# EAGLE design rotor_khamex_4.5 (EAGLE 7.6.0)

## Sheet 1 of 2
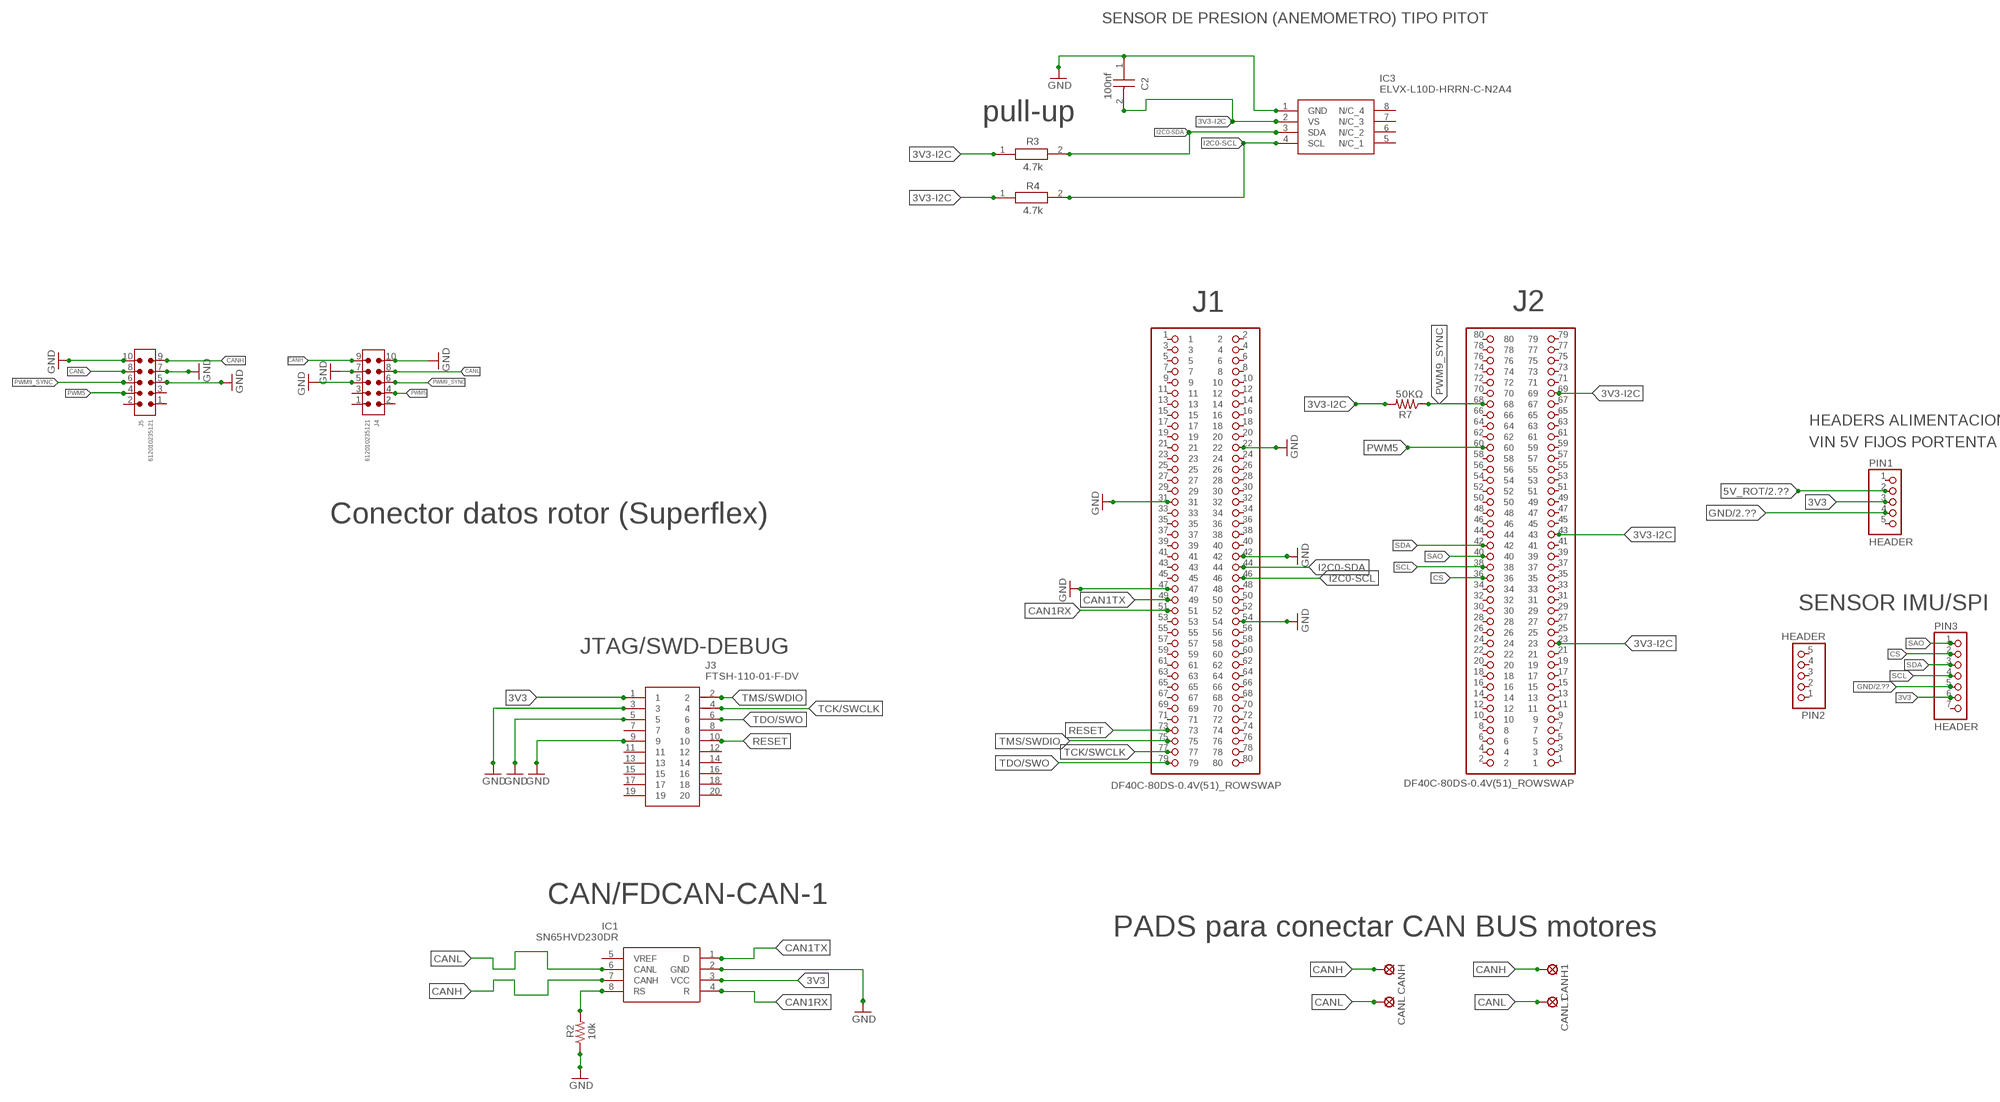
[diagram p0: schematic, sheet 1]

### Parts
C2  100nf  VJ0805Y104KCAAJ  [CAPC2012X145N]
CANH  LSP11  [LSP11]
CANH1  LSP11  [LSP11]
CANL  LSP11  [LSP11]
CANL1  LSP11  [LSP11]
IC1  SN65HVD230DR  [SOT127P600X175-8N]
IC3  ELVX-L10D-HRRN-C-N2A4  [ELVXL10DHRRNCN2A4]
J1  DF40C-80DS-0.4V(51)_ROWSWAP  [HRS_DF40C-80DS-0.4V(51)_ROWSWAP]
J2  DF40C-80DS-0.4V(51)_ROWSWAP  [HRS_DF40C-80DS-0.4V(51)_ROWSWAP]
J3  FTSH-110-01-F-DV  [FTSH-110-XX-YYY-DV]
J4  612010235121  6120XX235121_612010235121  [612010235121]
J5  612010235121  6120XX235121_612010235121  [612010235121]
PIN1  HEADER  PINHD-1X5  [1X05]
PIN2  HEADER  PINHD-1X5  [1X05]
PIN3  HEADER  PINHD-1X7  [1X07]
R2  10k  R-US_M0805  [M0805]
R3  4.7k  CRCW08054K70FKEA  [RESC2012X50N]
R4  4.7k  CRCW08054K70FKEA  [RESC2012X50N]
R7  50KΩ  R-US_M0805  [M0805]

### Nets
3V3: IC1.3(VCC) J3.1 PIN1.3 PIN3.6
3V3-I2C: C2.2 IC3.2(VS) J2.23 J2.43 J2.69 R3.1 R4.1 R7.2
5V_ROT: PIN1.2 ; also sheet 2
CAN1RX: IC1.4(R) J1.51
CAN1TX: IC1.1(D) J1.49
CANH: CANH1.MP CANH.MP IC1.7(CANH) J4.9 J5.9
CANL: CANL1.MP CANL.MP IC1.6(CANL) J4.8 J5.8
CS: J2.36 PIN3.2
GND [power]: C2.1 IC1.2(GND) IC3.1(GND) J1.22 J1.31 J1.42 J1.47 J1.54 J3.3 J3.5 J3.9 J4.5 J4.7 J4.10 J5.5 J5.7 J5.10 PIN1.4 PIN3.5 R2.1 ; also sheet 2
I2C0-SCL: IC3.4(SCL) J1.46 R4.2
I2C0-SDA: IC3.3(SDA) J1.44 R3.2
N$15: IC1.8(RS) R2.2
PWM5: J2.60 J4.4 J5.4
PWM9_SYNC: J2.68 J4.6 J5.6 R7.1
RESET: J1.73 J3.10
SAO: J2.40 PIN3.1
SCL: J2.38 PIN3.4
SDA: J2.42 PIN3.3
TCK/SWCLK: J1.77 J3.4
TDO/SWO: J1.79 J3.6
TMS/SWDIO: J1.75 J3.2
Unconnected: IC1.5(VREF) IC3.5(N/C_1) IC3.6(N/C_2) IC3.7(N/C_3) IC3.8(N/C_4) J1.1 J1.2 J1.3 J1.4 J1.5 J1.6 J1.7 J1.8 J1.9 J1.10 J1.11 J1.12 J1.13 J1.14 J1.15 J1.16 J1.17 J1.18 J1.19 J1.20 J1.21 J1.23 J1.24 J1.25 J1.26 J1.27 J1.28 J1.29 J1.30 J1.32 J1.33 J1.34 J1.35 J1.36 J1.37 J1.38 J1.39 J1.40 J1.41 J1.43 J1.45 J1.48 J1.50 J1.52 J1.53 J1.55 J1.56 J1.57 J1.58 J1.59 J1.60 J1.61 J1.62 J1.63 J1.64 J1.65 J1.66 J1.67 J1.68 J1.69 J1.70 J1.71 J1.72 J1.74 J1.76 J1.78 J1.80 J2.1 J2.2 J2.3 J2.4 J2.5 J2.6 J2.7 J2.8 J2.9 J2.10 J2.11 J2.12 J2.13 J2.14 J2.15 J2.16 J2.17 J2.18 J2.19 J2.20 J2.21 J2.22 J2.24 J2.25 J2.26 J2.27 J2.28 J2.29 J2.30 J2.31 J2.32 J2.33 J2.34 J2.35 J2.37 J2.39 J2.41 J2.44 J2.45 J2.46 J2.47 J2.48 J2.49 J2.50 J2.51 J2.52 J2.53 J2.54 J2.55 J2.56 J2.57 J2.58 J2.59 J2.61 J2.62 J2.63 J2.64 J2.65 J2.66 J2.67 J2.70 J2.71 J2.72 J2.73 J2.74 J2.75 J2.76 J2.77 J2.78 J2.79 J2.80 J3.7 J3.8 J3.11 J3.12 J3.13 J3.14 J3.15 J3.16 J3.17 J3.18 J3.19 J3.20 J4.1 J4.2 J4.3 J5.1 J5.2 J5.3 PIN1.1 PIN1.5 PIN2.1 PIN2.2 PIN2.3 PIN2.4 PIN2.5 PIN3.7

### Notes on the sheet
- SENSOR DE PRESION (ANEMOMETRO) TIPO PITOT
- pull-up
- 4.7k
- 4.7k
- HEADERS ALIMENTACION
- VIN 5V FIJOS PORTENTA
- Conector datos rotor (Superflex)
- SENSOR IMU/SPI
- JTAG/SWD-DEBUG
- CAN/FDCAN-CAN-1
- PADS para conectar CAN BUS motores

## Sheet 2 of 2
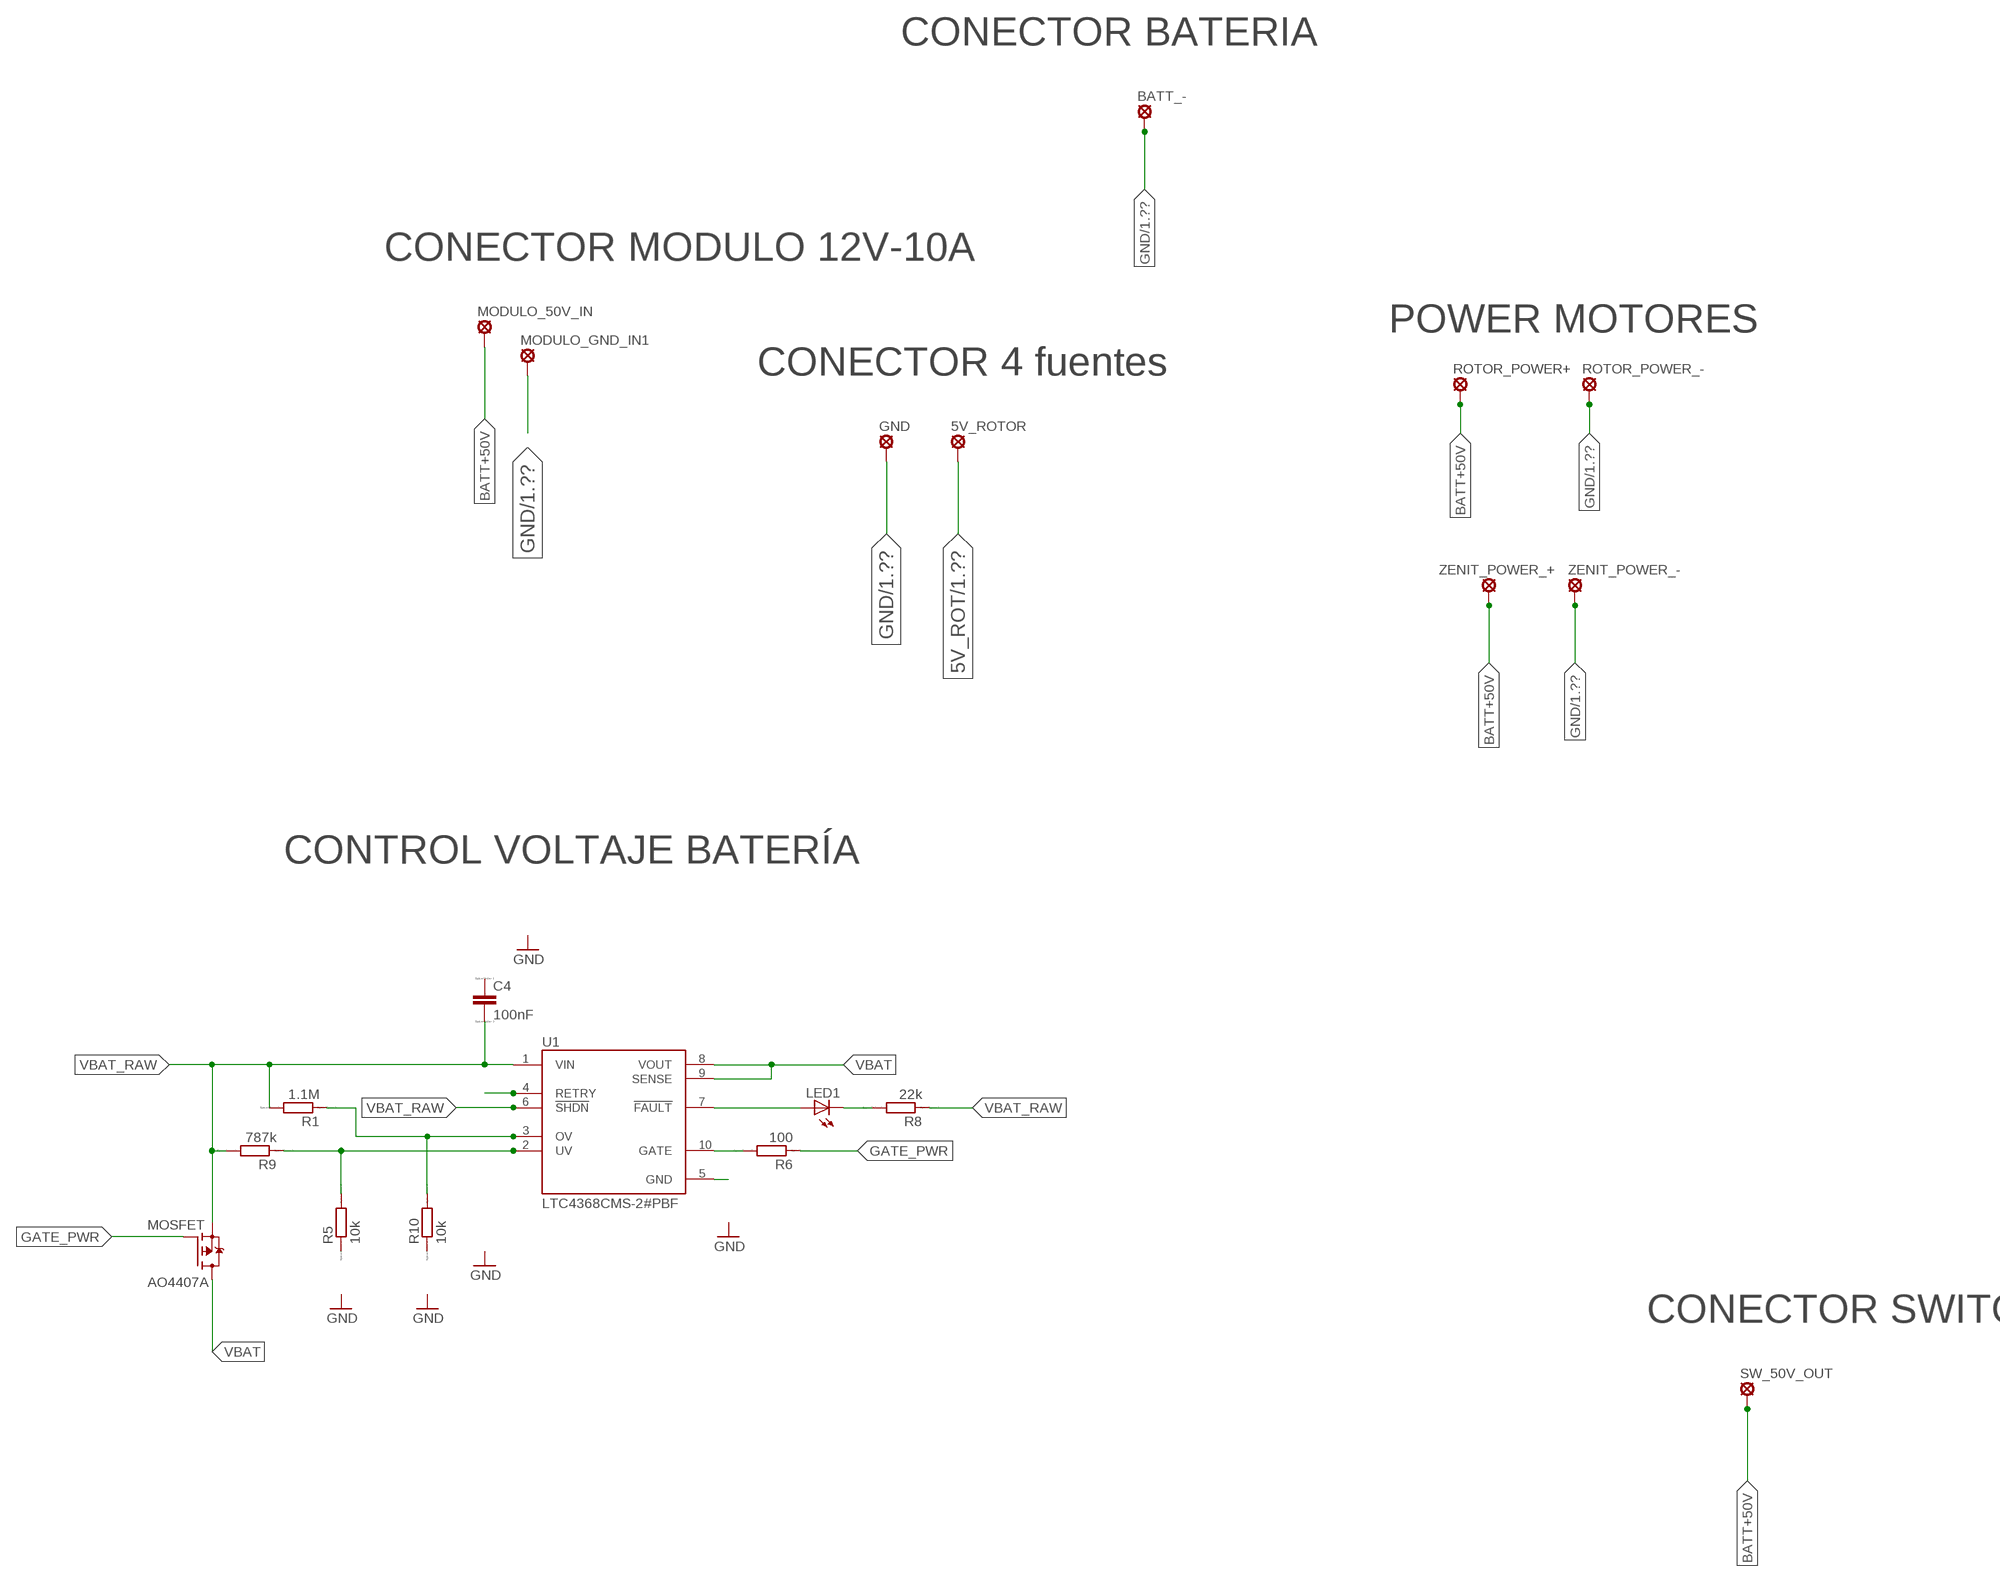
[diagram p1: schematic, sheet 2]

### Parts
5V_ROTOR  SE14  [SE14]
BATT_-  SE14  [SE14]
C4  100nF  C  [C0805]
GND  SE14  [SE14]
LED1  LED  [SMARTLED-TTW]
MODULO_50V_IN  SE14  [SE14]
MODULO_GND_IN1  SE14  [SE14]
MOSFET  AO4407A  [SOIC127P600X175-8N]
R1  1.1M  R  [R0805]
R5  10k  R  [R0805]
R6  100  R  [R0805]
R8  22k  R  [R0805]
R9  787k  R  [R0805]
R10  10k  R  [R0805]
ROTOR_POWER+  SE14  [SE14]
ROTOR_POWER_-  SE14  [SE14]
SW_50V_OUT  SE14  [SE14]
U1  LTC4368CMS-2#PBF  [SOP50P490X110-10N]
ZENIT_POWER_+  SE14  [SE14]
ZENIT_POWER_-  SE14  [SE14]

### Nets
5V_ROT: 5V_ROTOR.MP ; also sheet 1
BATT+50V [power]: MODULO_50V_IN.MP ROTOR_POWER+.MP SW_50V_OUT.MP ZENIT_POWER_+.MP
GATE_PWR: MOSFET.4(G) R6.1
GND [power]: BATT_-.MP GND.MP MODULO_GND_IN1.MP ROTOR_POWER_-.MP ZENIT_POWER_-.MP ; also sheet 1
N$2: LED1.A@1(A) U1.7(!FAULT)
N$11: R5.2 R9.1 U1.2(UV)
N$12: R1.1 R10.2 U1.3(OV)
N$13: LED1.C@1(C) R8.2
N$14: R6.2 U1.10(GATE)
N$20 [power]: U1.4(RETRY)
N$21 [power]: U1.5(GND)
VBAT: MOSFET.5(D) MOSFET.6(D) MOSFET.7(D) MOSFET.8(D) U1.8(VOUT) U1.9(SENSE)
VBAT_RAW: C4.2 MOSFET.1(S) MOSFET.2(S) MOSFET.3(S) R1.2 R8.1 R9.2 U1.1(VIN) U1.6(!SHDN)
Unconnected: C4.1 R5.1 R10.1

### Notes on the sheet
- CONECTOR BATERIA
- CONECTOR MODULO 12V-10A
- POWER MOTORES
- CONECTOR 4 fuentes
- CONTROL VOLTAJE BATERÍA
- CONECTOR SWITCH

## Library data of the parts
5V_ROTOR BATT_- GND MODULO_50V_IN MODULO_GND_IN1 ROTOR_POWER+ ROTOR_POWER_- SW_50V_OUT ZENIT_POWER_+ ZENIT_POWER_- = solpad:SE14: SOLDER PAD E1553, drill 1,4mm, distributor Buerklin, 07F820
C2 = VJ0805Y104KCAAJ:VJ0805Y104KCAAJ: Vishay VJ0805 series Capacitor Chips Source: Datasheet <http://www.vishay.com/docs/45226/vj31xrohsautomlcc.pdf>; DESCRIPTION: Vishay VJ0805 series Capacitor Chips; HEIGHT: 1.45mm; MANUFACTURER_NAME: Vishay; MANUFACTURER_PART_NUMBER: VJ0805Y104KCAAJ
C4 = eagle-ltspice:C: CAPACITOR, European symbol; SPICEMODEL: NONE; SPICEPREFIX: C
CANH CANH1 CANL CANL1 = solpad:LSP11: SOLDER PAD drill 1.1 mm
IC1 = SN65HVD230DR:SN65HVD230DR: 3.3 V CAN Transceiver with Standby Mode Source: Datasheet <http://www.ti.com/lit/gpn/sn65hvd230>; DESCRIPTION: 3.3 V CAN Transceiver with Standby Mode; HEIGHT: 1.75mm; MANUFACTURER_NAME: Texas Instruments; MANUFACTURER_PART_NUMBER: SN65HVD230DR; MOUSER_PART_NUMBER: 595-SN65HVD230DR; MOUSER_PRICE-STOCK: https://www.mouser.co.uk/ProductDetail/Texas-Instruments/SN65HVD230DR?qs=QViXGNcIEAtifeQR3pYVUQ%3D%3D
IC3 = ELVX-L10D-HRRN-C-N2A4:ELVX-L10D-HRRN-C-N2A4: Pressure Sensor +/-0.36PSI (+/-2.49kPa) Differential Male - 0.08" (1.93mm) Tube, Dual 14 b 8-SMD, No Lead, Dual Ports, Same Side, 3.3V, -25C ~ 85C Source: Datasheet <https://allsensors.com/hubfs/Product-Data-Sheets/DS-0452.pdf>; DESCRIPTION: Pressure Sensor +/-0.36PSI (+/-2.49kPa) Differential Male - 0.08" (1.93mm) Tube, Dual 14 b 8-SMD, No Lead, Dual Ports, Same Side, 3.3V, -25C ~ 85C; HEIGHT: 4.33mm; MANUFACTURER_NAME: Amphenol; MANUFACTURER_PART_NUMBER: ELVX-L10D-HRRN-C-N2A4
J1 J2 = DF40C-80DS-0.4V_51_ROWSWAP:DF40C-80DS-0.4V(51)_ROWSWAP; CHECK_PRICES: https://www.snapeda.com/parts/DF40C-80DS-0.4V(51)/Hirose/view-part/?ref=eda; DESCRIPTION: Receptáculo del conector de la posición 80, contactos de la tira central Montaje en superficie Oro; DIGIKEY_PART_NUMBER: H11633CT-ND; MF: Hirose; MP: DF40C-80DS-0.4V(51); PACKAGE: None; SNAPEDA_LINK: https://www.snapeda.com/parts/DF40C-80DS-0.4V(51)/Hirose/view-part/?ref=snap
J3 = FTSH-110-01-F-DV:FTSH-110-01-F-DV: 20 Position, High Reliability Header Strips, 0.050" pitch Source: Datasheet <http://suddendocs.samtec.com/prints/ftsh-1xx-xx-xxx-dv-xxx-xxx-mkt.pdf>; DESCRIPTION: 20 Position, High Reliability Header Strips, 0.050&quot; pitch; HEIGHT: mm; MANUFACTURER_NAME: SAMTEC; MANUFACTURER_PART_NUMBER: FTSH-110-01-F-DV; MOUSER_PART_NUMBER: 200-FTSH11001FDV; MOUSER_PRICE-STOCK: https://www.mouser.co.uk/ProductDetail/Samtec/FTSH-110-01-F-DV?qs=92ilVni64gw1JaTDl9rCLg%3D%3D
J4 J5 = Eagle_WR-BHD_rev24a:6120XX235121_612010235121: WR-BHD 2.54 mm Male Box Header High Temperature KIND PROPERTIES: Pitch 2.54 mm Gender:Male MATERIAL PROPERTIES: Insulator Material:PA6T Insulator Flammability Rating UL94 V-0 Insulator Color:Black Contact Material :Copper Alloy Contact Plating :Gold Contact Type: Stamped GENERAL INFORMATION: Operating Temperature:-40 °C up to +125 °C Compliance:RoHS Working Voltage: 250 V (AC) Withstanding Voltage:500 V (AC) Contact Resistance: 20 mΩ Insulation Resistance:1000 MΩ PACKAGING PROPERTIES Packaging :Tray <https://www.we-online.com/catalog/media/o32904v209%20Family_WR-BHD_6120xx235121.jpg> Details see: https://www.we-online.com/catalog/en/BHD_2_54_MALE_BOX_HEADER_HIGH_TEMPERATURE_6120XX235121 Updated by Ella Wu 2021-03-12 2021 (C) Würth Elektronik; CONTACT-RESISTANCE: 20mOhm; DATASHEET-URL: https://www.we-online.com/redexpert/spec/612010235121?ae; GENDER: Male; IR: 3A; LENGTH: 20.3mm; MOUNT: THT; PACKAGING: Tray; PART-NUMBER: 612010235121; PINS: 10; PITCH: 2.54mm; TYPE: Straight; WORKING-VOLTAGE: 250V(AC)
LED1 = led:LED: LED OSRAM: - CHIPLED LG R971, LG N971, LY N971, LG Q971, LY Q971, LO R971, LY R971 LH N974, LH R974 LS Q976, LO Q976, LY Q976 LO Q996 - Hyper CHIPLED LW Q18S LB Q993, LB Q99A, LB R99A - SideLED LS A670, LO A670, LY A670, LG A670, LP A670 LB A673, LV A673, LT A673, LW A673 LH A674 LY A675 LS A676, LA A676, LO A676, LY A676, LW A676 LS A679, LY A679, LG A679 - Hyper Micro SIDELED® LS Y876, LA Y876, LO Y876, LY Y876 LT Y87S - SmartLED LW L88C, LW L88S LB L89C, LB L89S, LG L890 LS L89K, LO L89K, LY L89K LS L896, LA L896, LO L896, LY L896 - TOPLED LS T670, LO T670, LY T670, LG T670, LP T670 LSG T670, LSP T670, LSY T670, LOP T670, LYG T670 LG T671, LOG T671, LSG T671 LB T673, LV T673, LT T673, LW T673 LH T674 LS T676, LA T676, LO T676, LY T676, LB T676, LH T676, LSB T676, LW T676 LB T67C, LV T67C, LT T67C, LS T67K, LO T67K, LY T67K, LW E67C LS E67B, LA E67B, LO E67B, LY E67B, LB E67C, LV E67C, LT E67C LW T67C LS T679, LY T679, LG T679 LS T770, LO T770, LY T770, LG T770, LP T770 LB T773, LV T773, LT T773, LW T773 LH T774 LS E675, LA E675, LY E675, LS T675 LS T776, LA T776, LO T776, LY T776, LB T776 LHGB T686 LT T68C, LB T68C - Hyper Mini TOPLED® LB M676 - Mini TOPLED Santana® LG M470 LS M47K, LO M47K, LY M47K Source: http://www.osram.convergy.de LUXEON: - LUMILED® LXK2-PW12-R00, LXK2-PW12-S00, LXK2-PW14-U00, LXK2-PW14-V00 LXK2-PM12-R00, LXK2-PM12-S00, LXK2-PM14-U00 LXK2-PE12-Q00, LXK2-PE12-R00, LXK2-PE12-S00, LXK2-PE14-T00, LXK2-PE14-U00 LXK2-PB12-K00, LXK2-PB12-L00, LXK2-PB12-M00, LXK2-PB14-N00, LXK2-PB14-P00, LXK2-PB14-Q00 LXK2-PR12-L00, LXK2-PR12-M00, LXK2-PR14-Q00, LXK2-PR14-R00 LXK2-PD12-Q00, LXK2-PD12-R00, LXK2-PD12-S00 LXK2-PH12-R00, LXK2-PH12-S00 LXK2-PL12-P00, LXK2-PL12-Q00, LXK2-PL12-R00 Source: www.luxeon.com KINGBRIGHT: KA-3528ASYC Source: www.kingbright.com
MOSFET = AO4407A:AO4407A: Check availability <https://pricing.snapeda.com/parts/AO4407A/Alpha%20%26/view-part?ref=eda>; AVAILABILITY: In Stock; CHECK_PRICES: https://www.snapeda.com/parts/AO4407A/Alpha/view-part/?ref=eda; DESCRIPTION: P-Channel 30 V 12A (Ta) 3.1W (Ta) Surface Mount 8-SOIC; MF: Alpha &; MP: AO4407A; PACKAGE: SOIC-8 Alpha &amp; Omega Semiconductor; PRICE: None; SNAPEDA_LINK: https://www.snapeda.com/parts/AO4407A/Alpha/view-part/?ref=snap
PIN1 PIN2 = pinhead:PINHD-1X5: PIN HEADER
PIN3 = pinhead:PINHD-1X7: PIN HEADER
R1 R5 R6 R8-R10 = eagle-ltspice:R: RESISTOR, European symbol; SPICEMODEL: NONE; SPICEPREFIX: R
R2 R7 = rcl:R-US_: RESISTOR, American symbol
R3 R4 = CRCW08054K70FKEA:CRCW08054K70FKEA: Vishay CRCW Series Thick Film Surface Mount Resistor 805 Case 4.7k +/-1% 0.125W +/-100ppm/C Source: Datasheet <http://www.vishay.com/docs/20035/dcrcwe3.pdf>; DESCRIPTION: Vishay CRCW Series Thick Film Surface Mount Resistor 805 Case 4.7k +/-1% 0.125W +/-100ppm/C; HEIGHT: 0.5mm; MANUFACTURER_NAME: Vishay; MANUFACTURER_PART_NUMBER: CRCW08054K70FKEA; MOUSER_PART_NUMBER: 71-CRCW0805-4.7K-E3; MOUSER_PRICE-STOCK: https://www.mouser.co.uk/ProductDetail/Vishay-Dale/CRCW08054K70FKEA?qs=kkyyugUlSrMIzNiWjd4LGQ%3D%3D
U1 = LTC4368CMS-2_PBF:LTC4368CMS-2#PBF: Check availability <https://pricing.snapeda.com/parts/LTC4368CMS-2%23PBF/Analog%20Devices/view-part?ref=eda>; AVAILABILITY: In Stock; CHECK_PRICES: https://www.snapeda.com/parts/LTC4368CMS-2%23PBF/Analog+Devices/view-part/?ref=eda; DESCRIPTION: 100V UV/OV and Reverse Protection Controller with Bidirectional Circuit Breaker; MF: Analog Devices; MP: LTC4368CMS-2#PBF; PACKAGE: MSOP-10 Analog Devices; PRICE: None; SNAPEDA_LINK: https://www.snapeda.com/parts/LTC4368CMS-2%23PBF/Analog+Devices/view-part/?ref=snap

## Net classes
0 default: width 0.152 mm, drill 0.305 mm, clearance 0.152 mm
1 power: width 0.127 mm, drill 0.305 mm, clearance 0.127 mm
2 thin: width 0.508 mm, drill 0.305 mm, clearance 0.152 mm

## Board
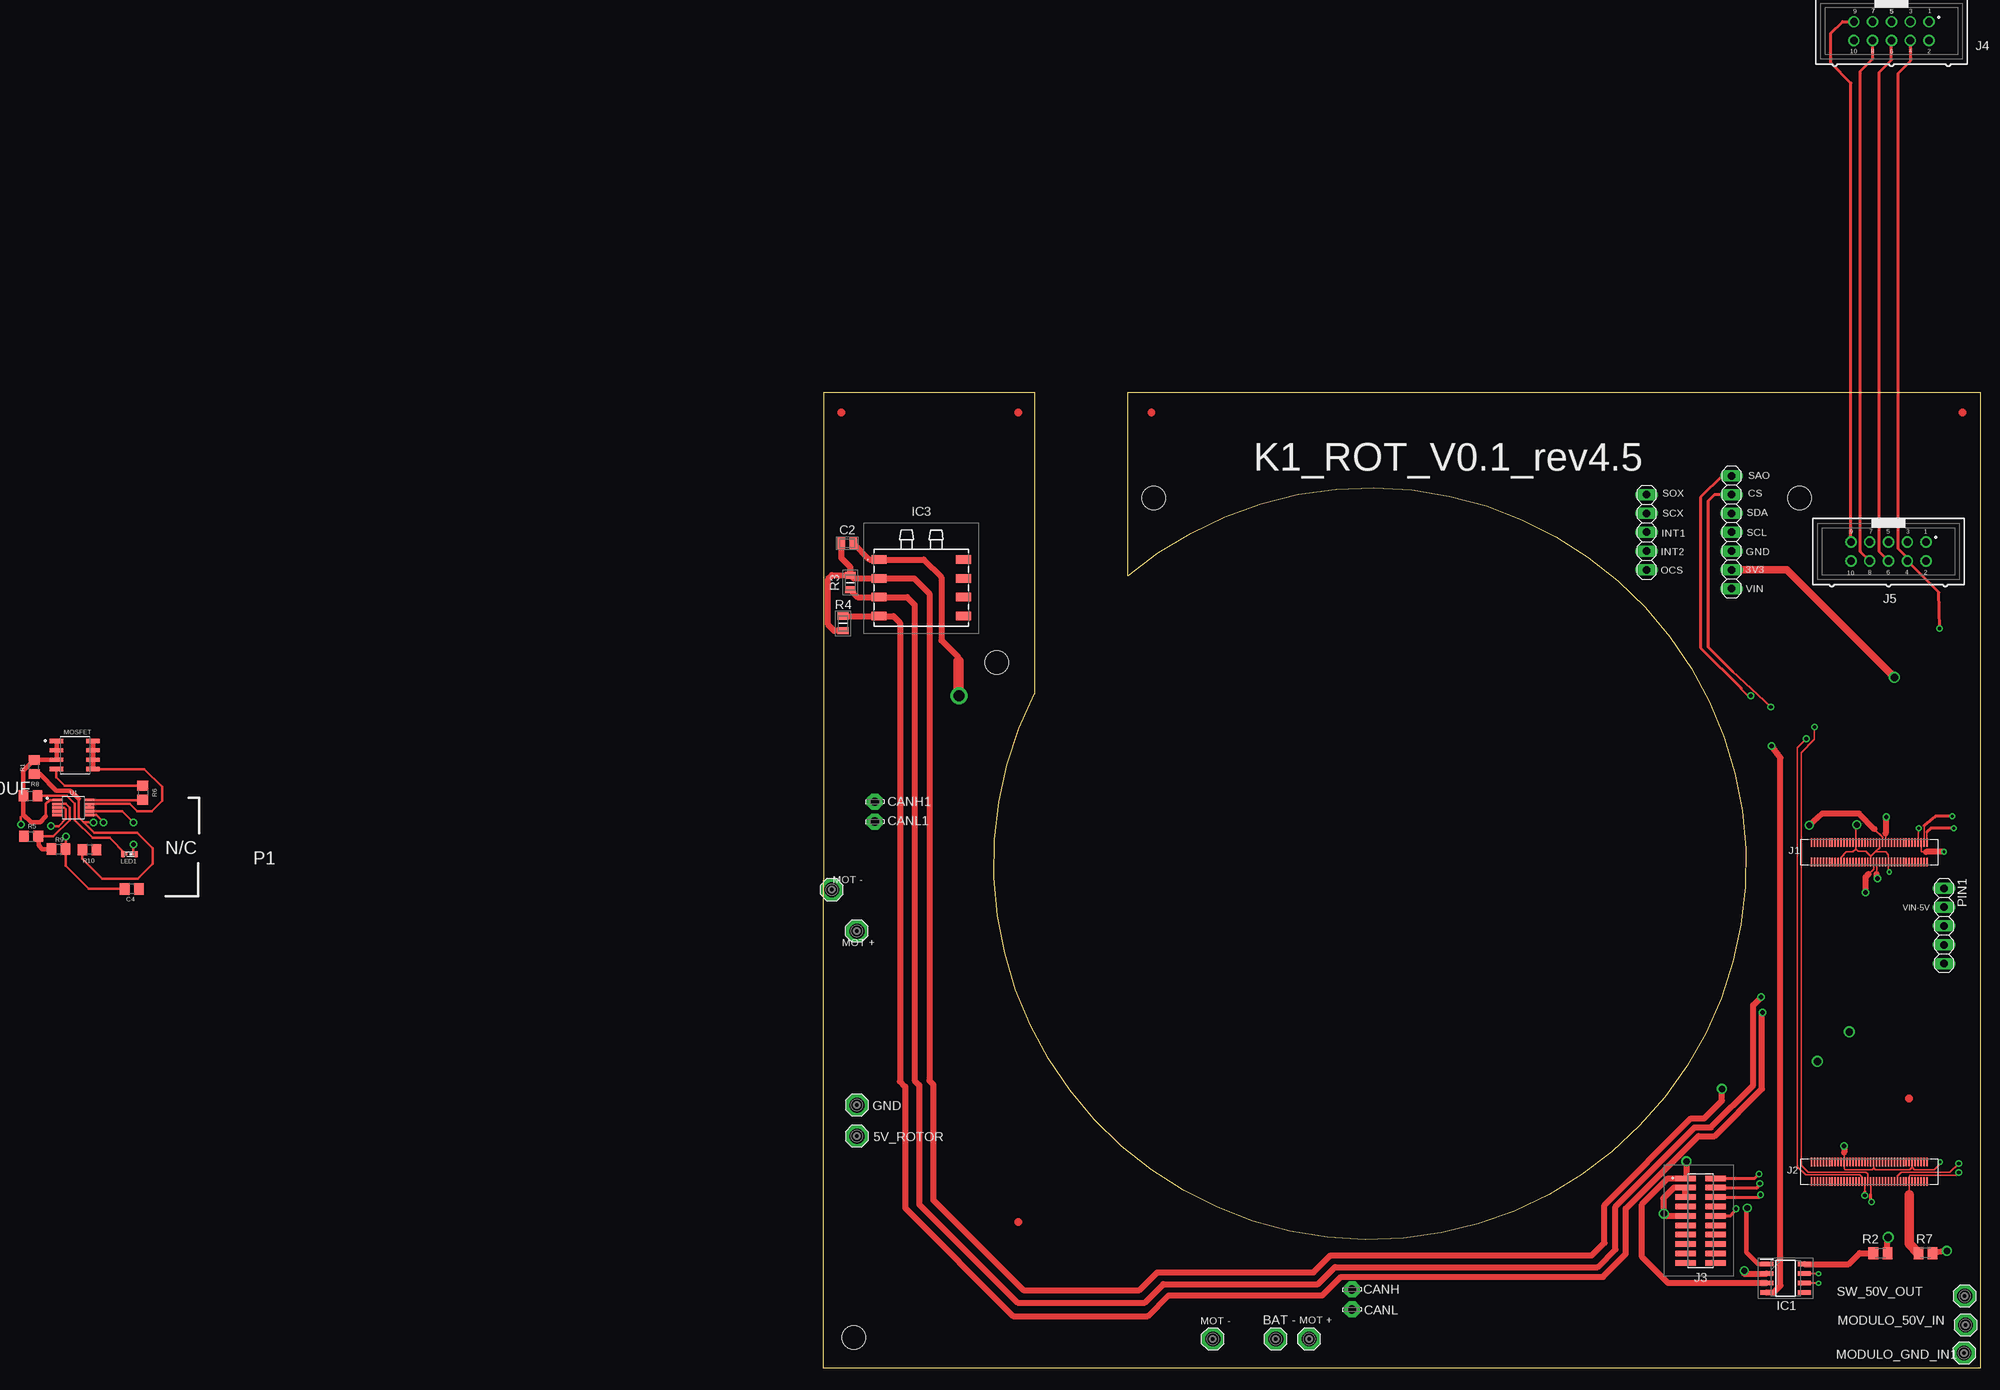
[diagram p2: board, top side]
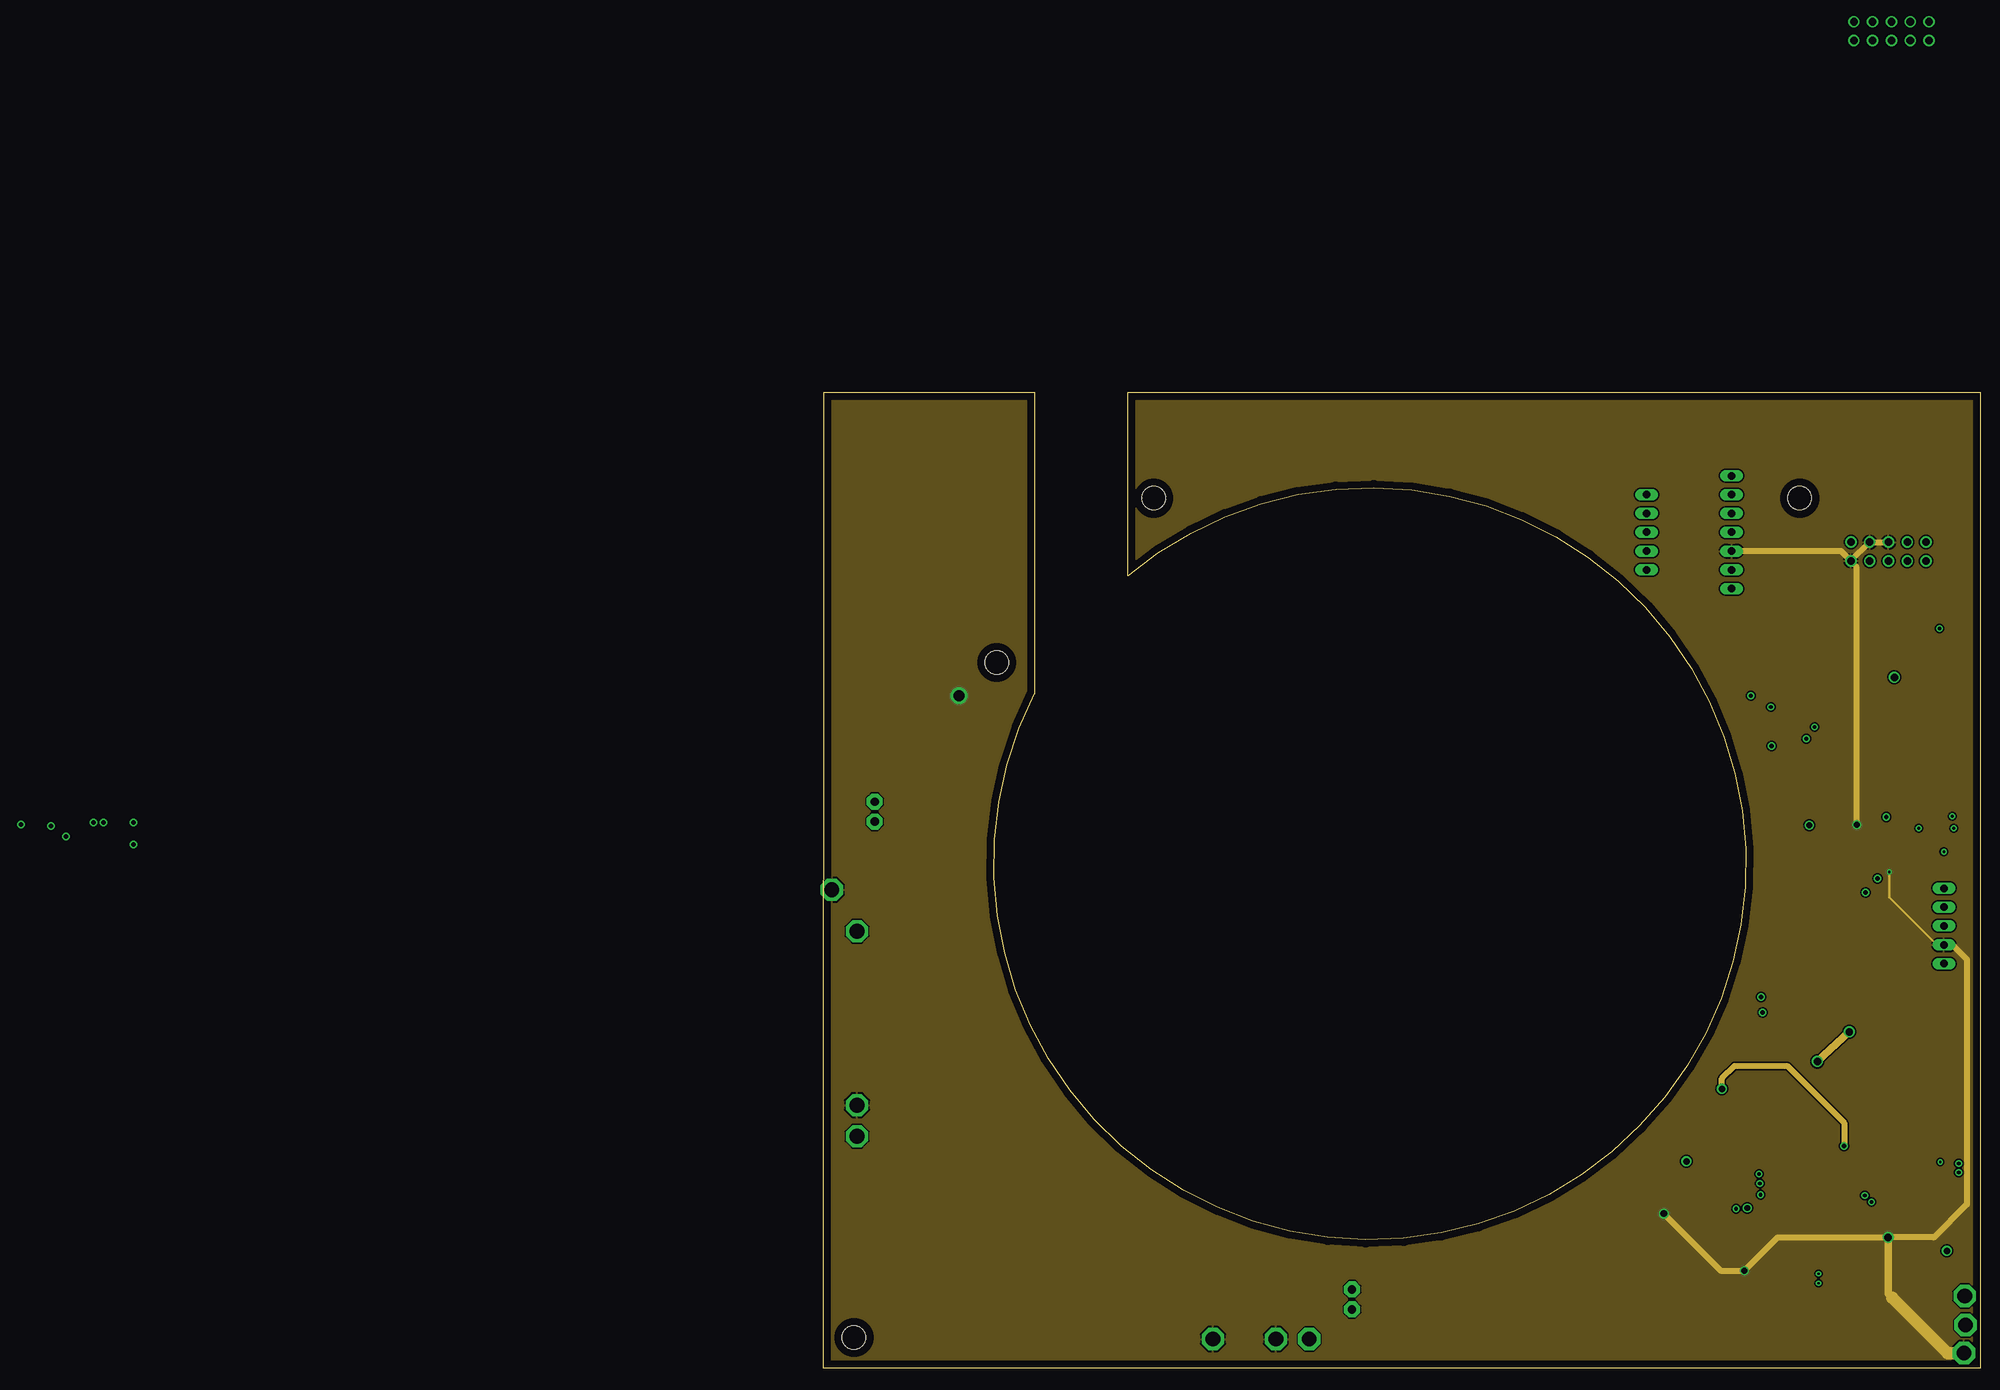
[diagram p3: board, inner layer Route2]
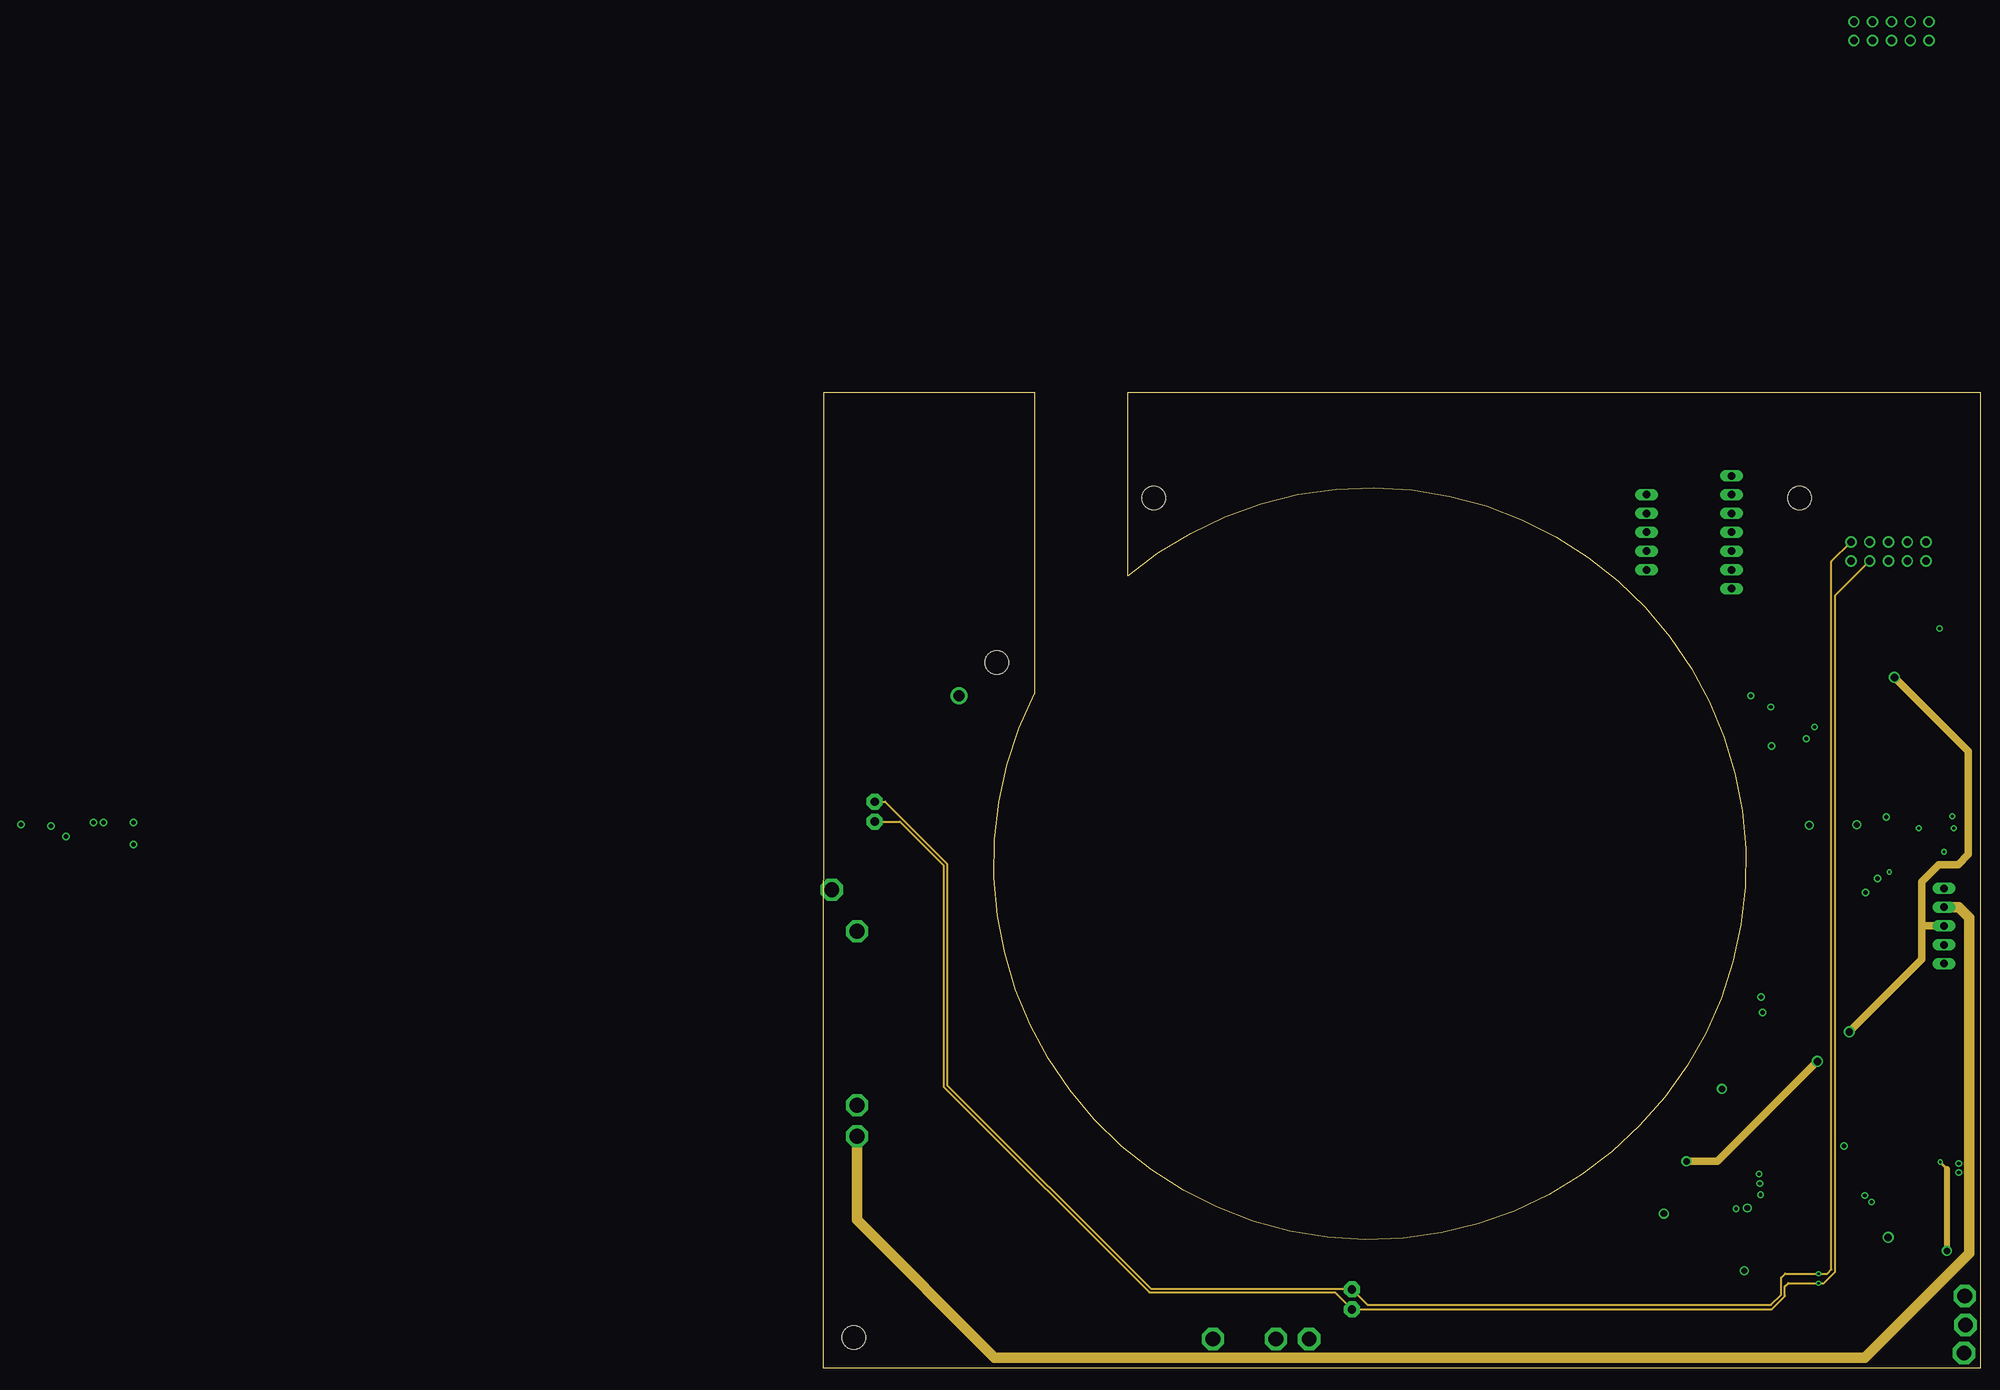
[diagram p4: board, inner layer Route15]
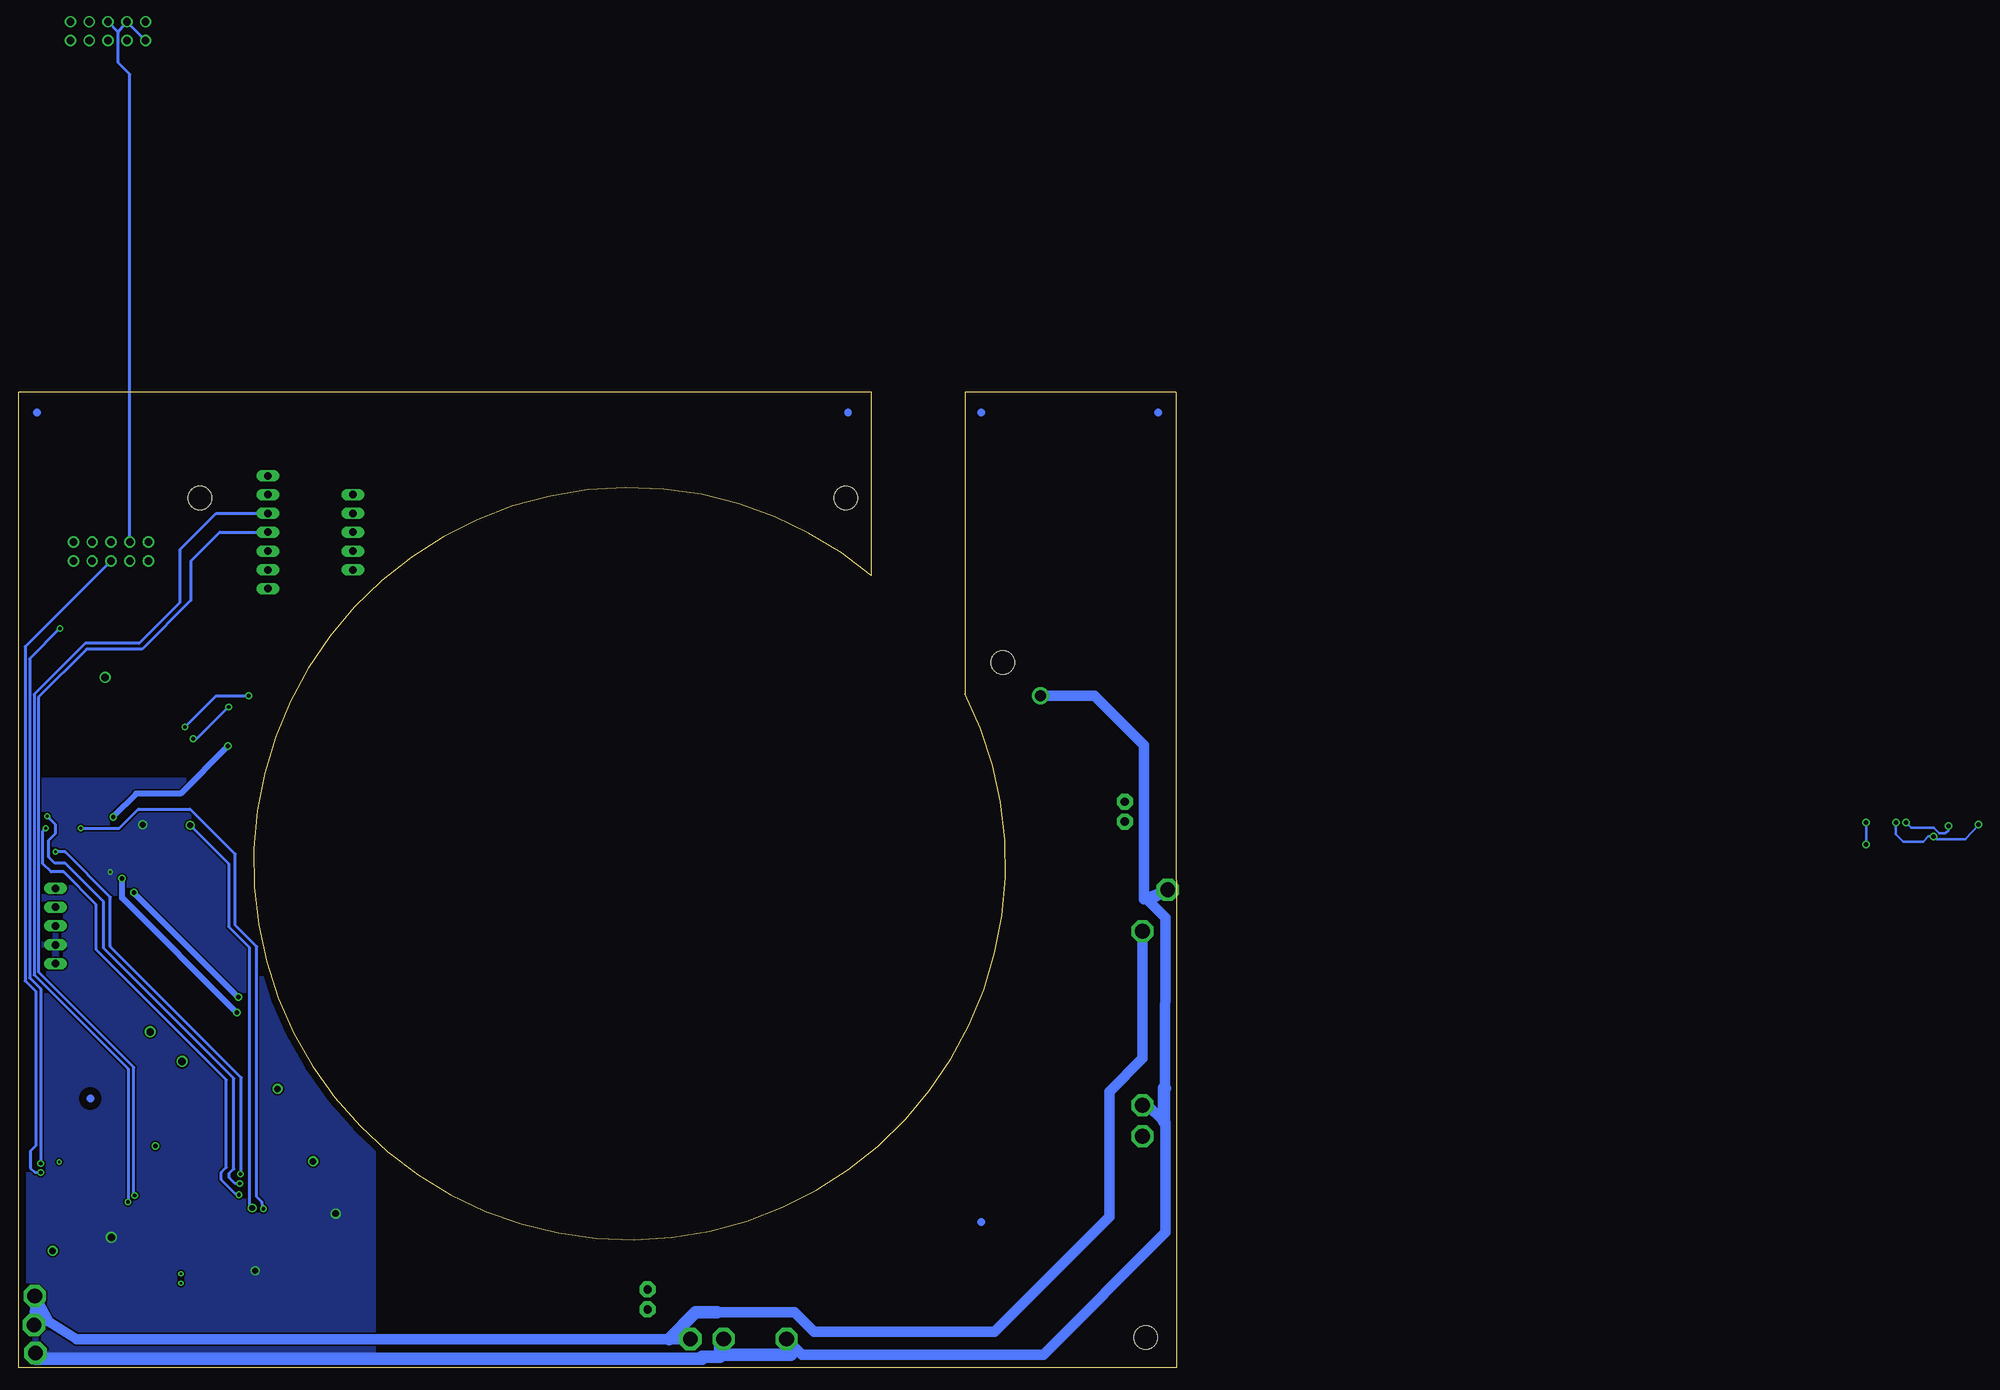
[diagram p5: board, bottom side, seen from below]

Size 156.5 x 131.8 mm. Coordinates in mm from the lower left corner, seen from the top.
Outline: 28.6,91.1 28.6,131.8 0.1,131.8 0,0 156.5,0 156.5,131.8 41.2,131.8 41.2,107 arc-337 28.6,91.1
Outline: 28.6,91.1 28.6,91
Copper layers (1*2*15*16): Top 0.035mm / dielectric 1.15mm / Route2 0.035mm / dielectric 0.13mm / Route15 0.035mm / dielectric 0.13mm / Bottom 0.035mm
Design rules "default *": minimum track width 10mil, minimum drill 24mil, track to track 8mil, track to pad 8mil, pad to pad 8mil, via to via 8mil, smd to smd 8mil, copper to edge 40mil, drill to drill 8mil, minimum pad ring 10mil, minimum via ring 8mil, stop-mask expansion 4mil, vias tented up to drill 0mil, thermal gap 10mil
Holes 3.2 mm at 132,117.5 4.2,4.1 23.5,95.3 44.7,117.5

### Footprints (pad centres in the part's own frame; a part is rotated, then mirrored left to right if it is on the bottom)
SE14 = drill 2 pad 3 octagon: MP 0,0
CAPC2012X145N = smd 0.99 x 1.47: 1 -0.82,0; 2 0.82,0
C0805 = smd 1.3 x 1.5: 1 -0.95,0; 2 0.95,0
LSP11 = drill 1.118 pad 2.159 octagon: MP 0,0
SOT127P600X175-8N = smd 1.75 x 0.6: 1 -2.55,1.905; 2 -2.55,0.635; 3 -2.55,-0.635; 4 -2.55,-1.905; 5 2.55,-1.905; 6 2.55,-0.635; 7 2.55,0.635; 8 2.55,1.905
ELVXL10DHRRNCN2A4 = smd 2.03 x 1.14: 1 -5.715,2.5; 2 -5.715,-0.04; 3 -5.715,-2.58; 4 -5.715,-5.12; 5 5.715,-5.12; 6 5.715,-2.58; 7 5.715,-0.04; 8 5.715,2.5
HRS_DF40C-80DS-0.4V(51)_ROWSWAP = smd 0.2 x 1.14: 1 -7.8,1.32; 2 -7.8,-1.32; 3 -7.4,1.32; 4 -7.4,-1.32; 5 -7,1.32; 6 -7,-1.32; 7 -6.6,1.32; 8 -6.6,-1.32; 9 -6.2,1.32; 10 -6.2,-1.32; 11 -5.8,1.32; 12 -5.8,-1.32; 13 -5.4,1.32; 14 -5.4,-1.32; 15 -5,1.32; 16 -5,-1.32; 17 -4.6,1.32; 18 -4.6,-1.32; 19 -4.2,1.32; 20 -4.2,-1.32; 21 -3.8,1.32; 22 -3.8,-1.32; 23 -3.4,1.32; 24 -3.4,-1.32; 25 -3,1.32; 26 -3,-1.32; 27 -2.6,1.32; 28 -2.6,-1.32; 29 -2.2,1.32; 30 -2.2,-1.32; 31 -1.8,1.32; 32 -1.8,-1.32; 33 -1.4,1.32; 34 -1.4,-1.32; 35 -1,1.32; 36 -1,-1.32; 37 -0.6,1.32; 38 -0.6,-1.32; 39 -0.2,1.32; 40 -0.2,-1.32; 41 0.2,1.32; 42 0.2,-1.32; 43 0.6,1.32; 44 0.6,-1.32; 45 1,1.32; 46 1,-1.32; 47 1.4,1.32; 48 1.4,-1.32; 49 1.8,1.32; 50 1.8,-1.32; 51 2.2,1.32; 52 2.2,-1.32; 53 2.6,1.32; 54 2.6,-1.32; 55 3,1.32; 56 3,-1.32; 57 3.4,1.32; 58 3.4,-1.32; 59 3.8,1.32; 60 3.8,-1.32; 61 4.2,1.32; 62 4.2,-1.32; 63 4.6,1.32; 64 4.6,-1.32; 65 5,1.32; 66 5,-1.32; 67 5.4,1.32; 68 5.4,-1.32; 69 5.8,1.32; 70 5.8,-1.32; 71 6.2,1.32; 72 6.2,-1.32; 73 6.6,1.32; 74 6.6,-1.32; 75 7,1.32; 76 7,-1.32; 77 7.4,1.32; 78 7.4,-1.32; 79 7.8,1.32; 80 7.8,-1.32
FTSH-110-XX-YYY-DV = smd 0.74 x 2.79: 1 -5.715,-2.035; 2 -5.715,2.035; 3 -4.445,-2.035; 4 -4.445,2.035; 5 -3.175,-2.035; 6 -3.175,2.035; 7 -1.905,-2.035; 8 -1.905,2.035; 9 -0.635,-2.035; 10 -0.635,2.035; 11 0.635,-2.035; 12 0.635,2.035; 13 1.905,-2.035; 14 1.905,2.035; 15 3.175,-2.035; 16 3.175,2.035; 17 4.445,-2.035; 18 4.445,2.035; 19 5.715,-2.035; 20 5.715,2.035
612010235121 = drill 1.02: 1 -5.08,-1.27; 2 -5.08,1.27; 3 -2.54,-1.27; 4 -2.54,1.27; 5 0,-1.27; 6 0,1.27; 7 2.54,-1.27; 8 2.54,1.27; 9 5.08,-1.27; 10 5.08,1.27
SMARTLED-TTW = smd 0.8 x 0.5: A 0,-0.875; C 0,0.875 | smd 0.35 x 0.35: A@1 0,-0.5; C@1 0,0.5
SOIC127P600X175-8N = smd 1.97 x 0.6: 1 -2.475,1.905; 2 -2.475,0.635; 3 -2.475,-0.635; 4 -2.475,-1.905; 5 2.475,-1.905; 6 2.475,-0.635; 7 2.475,0.635; 8 2.475,1.905
1X05 = drill 1.016 long: 1 -5.08,0; 2 -2.54,0; 3 0,0; 4 2.54,0; 5 5.08,0
1X07 = drill 1.016 long: 1 -7.62,0; 2 -5.08,0; 3 -2.54,0; 4 0,0; 5 2.54,0; 6 5.08,0; 7 7.62,0
R0805 = smd 1.3 x 1.5: 1 -0.95,0; 2 0.95,0
M0805 = smd 1.3 x 1.6: 1 -0.95,0; 2 0.95,0
RESC2012X50N = smd 0.95 x 1.45: 1 -1,0; 2 1,0
SOP50P490X110-10N = smd 1.45 x 0.28: 1 -2.16,1; 2 -2.16,0.5; 3 -2.16,0; 4 -2.16,-0.5; 5 -2.16,-1; 6 2.16,-1; 7 2.16,-0.5; 8 2.16,0; 9 2.16,0.5; 10 2.16,1

### Placement (x,y rotation side)
5V_ROTOR  4.6,31.3 0 top
BATT_-  52.7,3.9 180 top
C2  3.3,111.4 180 top
C4  -93.4,64.7 180 top  (outside the outline)
CANH  71.5,10.6 0 top
CANH1  7,76.5 0 top
CANL  71.5,7.9 0 top
CANL1  7,73.8 0 top
GND  4.6,35.5 0 top
IC1  130.1,12.1 0 top
IC3  13.3,106.7 0 top
J1  141.4,69.68 0 top
J2  141.4,26.49 0 top
J3  118.6,19.9 270 top
J4  144.4,180.6 180 top  (outside the outline)
J5  144,110.3 180 top
LED1  -93.7,69.4 90 top  (outside the outline)
MODULO_50V_IN  154.4,5.8 0 top
MODULO_GND_IN1  154.2,2 0 top
MOSFET  -101.1,82.8 0 top  (outside the outline)
PIN1  151.5,59.7 270 top
PIN2  111.3,112.9 90 top
PIN3  122.8,112.9 270 top
R1  -106.6,81.2 90 top  (outside the outline)
R2  142.9,15.5 180 top
R3  3.7,106.1 270 top
R4  2.71,100.58 90 top
R5  -107,71.8 0 top  (outside the outline)
R6  -91.9,77.7 270 top  (outside the outline)
R7  149,15.5 0 top
R8  -107.1,77.3 0 top  (outside the outline)
R9  -103.3,70.1 0 top  (outside the outline)
R10  -99.1,70 180 top  (outside the outline)
ROTOR_POWER+  65.7,3.9 180 top
ROTOR_POWER_-  61.2,3.9 180 top
SW_50V_OUT  154.3,9.7 0 top
U1  -101.3,75.7 0 top  (outside the outline)
U$1  [CIRCLE-1MM-3R]  26.4,129.1 0 top
U$3  [CIRCLE-1MM-3R]  154,129.1 0 top
U$4  [CIRCLE-1MM-3R]  146.8,36.4 0 top
U$5  [CIRCLE-1MM-3R]  2.5,129.1 0 top
U$6  [CIRCLE-1MM-3R]  26.4,19.7 0 top
U$7  [CIRCLE-1MM-3R]  44.4,129.1 0 top
ZENIT_POWER_+  4.6,59 180 top
ZENIT_POWER_-  1.2,64.6 180 top

### Tracks (layer width: path | path; a pad name or v marks a point on that pad's centre or on a via)
3V3  (via drill 0.9, 1)
  Top 0.813: IC1.3 114.23,11.46 110.7,15 110.7,22.1 114.2,25.6 J3.1 116.7,25.75 v116.7,27.9
  Top 1.016: PIN3.6 130.28,107.82 v144.8,93.3
  Route2 1.016: v138.7,45.4 v134.4,41.4
  Route15 1.016: v144.8,93.3 154.8,83.3 154.8,69.4 153.4,68 150.8,68 148.5,65.7 148.5,59.7 | 148.5,59.7 PIN1.3 | v134.4,41.4 120.9,27.9 v116.7,27.9 | v138.7,45.4 148.5,55.2 148.5,59.7
3V3-I2C  (via drill 0.3, 0.6, 0.9)
  Top 0.2: J2.69 147.2,27.1 | 142,27 142.2,26.8 146.9,26.8 147.2,27.1 | J2.43 142,27 | 142,27 141.8,26.8 138.1,26.8 138,26.9 J2.23 138,29.1 | 147.2,27.1 147.5,26.8 150.2,26.8 151,27.6 v151,27.8
  Top 0.813: R3.1 1.2,107.1 0.7,106.6 0.7,100.4 1.52,99.58 R4.1 | R3.1 3.7,108.2 2.5,109.4 2.5,111.38 C2.2 | R3.1 4.14,106.66 IC3.2 12.34,106.66 14.4,104.6 14.4,38.8 14.9,38.3 14.9,22.7 27.1,10.5 42.8,10.5 45.2,12.9 66.3,12.9 68.6,15.2 103.9,15.2 105.6,16.9 105.6,22 117.3,33.7 119.1,33.7 121.5,36.1 v121.5,37.7 | v151.9,15.8 R7.2 | v138,30 138,29.1
  Route2 0.813: v121.5,37.7 121.5,39.1 123.2,40.8 130.3,40.8 138,33.1 v138,30
  Route15 0.406: 151.9,26.9 v151,27.8
  Route15 0.813: 151.9,26.9 v151.9,15.8
5V_ROT
  Route15 1.422: 5V_ROTOR.MP 4.6,20 23.2,1.4 140.8,1.4 154.9,15.5 154.9,60.8 153.5,62.2 151.54,62.2 PIN1.2
BATT+50V
  Bottom 1.27: SW_50V_OUT.MP MODULO_50V_IN.MP
  Bottom 1.422: ZENIT_POWER_+.MP 4.6,41.8 9.1,37.3 9.1,20.4 24.6,4.9 49,4.9 51.6,7.5 62.1,7.5 | ROTOR_POWER+.MP 68.6,3.9 148.6,3.9 152.5,6.3 SW_50V_OUT.MP
  Bottom 1.676: 62.1,7.5 65,7.5 68.6,3.9
CAN1RX  (via drill 0.6)
  Top 0.2: 143.6,72.2 J1.51
  Top 0.813: IC1.4 128.5,10.2 129.4,11.1 129.4,82.4 v128.2,84 | v143.7,74.4 143.6,74.3 143.6,72.2
  Bottom 0.813: v128.2,84 134.6,77.6 140.6,77.6 143.7,74.5 v143.7,74.4
CAN1TX  (via drill 0.8)
  Top 0.2: J1.49 143.2,71.7 142.1,72.8
  Top 0.61: IC1.1 126.39,14.01 124.8,15.6 124.8,21.5 arc-90 v124.9,21.6
  Top 0.813: v133.3,73.3 135.1,74.9 140,74.9 142.1,72.8
  Bottom 0.406: v133.3,73.3 128.1,68.1 128.1,59.6 125.3,56.8 125.3,22 v124.9,21.6
CANH  (via drill 0.3)
  Top 0.254: IC1.7 v134.54,12.73
  Top 0.406: J4.9 139.29,181.9 137.8,181.9 136.2,180.3 136.2,176.3 138.92,173.58 J5.9
  Route15 0.254: CANH1.MP 8.4,76.5 16.8,68.1 16.8,38.2 44.3,10.7 71.4,10.7 CANH.MP 73.6,8.5 128.1,8.5 129.5,9.9 129.5,12.2 130.03,12.73 v134.54,12.73 135.73,12.73 136.3,13.3 136.3,108.95 J5.9
CANL  (via drill 0.3)
  Top 0.254: 132.63,11.45 IC1.6 v134.54,11.45
  Top 0.406: J4.8 141.9,179.29 141.9,176.9 140.2,175.2 140.2,110.29 J5.8
  Route15 0.254: CANL1.MP 10.4,73.8 16.3,67.9 16.3,38 44.1,10.2 69.2,10.2 CANL.MP 128.2,7.9 130,9.7 130,11.03 130.43,11.46 v134.54,11.46 | v134.54,11.46 v134.54,11.45 | v134.54,11.46 135.26,11.46 136.8,13 136.8,104.37 J5.8
CS  (via drill 0.5)
  Top 0.2: J2.36 140.4,25.8 140.1,26.1 132.8,26.1 131.7,27.2 131.7,83.8 v132.9,85 | v128.1,89.3 122.9,94.1
  Top 0.406: PIN3.2 120.48,117.98 119.6,117.1 119.6,97.4 122.9,94.1
  Bottom 0.406: v132.9,85 132.4,85 v128.1,89.3
GATE_PWR
  Top 0.305: R6.1 -102.45,78.65 -103.6,79.8 -103.6,80.87 MOSFET.4
GND  (via drill 0.3, 0.8, 0.9, 1, 1.5)
  Top 0.2: J1.22 137.6,69 138.3,69.7 139.2,69.7 139.6,70.1 | 139.6,70.1 J1.31 139.6,73.4 v139.7,73.4 | 141.6,69.1 140.9,69.8 139.9,69.8 139.6,70.1 | J1.47 142.8,70.3 142.2,69.7 | J1.42 141.6,69.1 | 141.6,69.1 142.2,69.7 | 142.2,69.7 143.6,69.7 144,69.3 J1.54 144,67.1 v144.1,67
  Top 0.813: C2.1 6.32,109.2 IC3.1 13.6,109.2 16,106.8 16,98.3 18.3,96 18.3,95.5 | R2.1 143.85,17.34 | J3.9 113.56,20.54 v113.64,20.85 113.56,20.57 113.56,22.89 115.02,24.34 J3.3 J3.5 | 143.85,17.35 143.85,17.34 | 143.85,17.34 v143.96,17.64 | v124.5,13.1 124.47,12.73 IC1.2
  Top 1.422: v18.4,90.8 18.3,90.9 18.3,95.5
  Route2 0.305: PIN1.4 150.54,57.16 144.1,63.6 v144.1,67
  Route2 0.813: J5.10 139.7,108.15 v139.7,73.4 | J5.10 J5.7 J5.5 | v113.64,20.85 121.42,13.07 124.47,13.07 v124.5,13.1 129.04,17.64 v143.96,17.64 150.06,17.64 150.1,17.6 154.6,22.1 154.6,55.2 152.64,57.16 PIN1.4 | J5.10 137.59,110.36 PIN3.5
  Route2 1.016: 144.5,9.5 143.96,10.04 v143.96,17.64
  Route2 1.422: v113.64,20.84 v113.64,20.85
  Route2 1.676: MODULO_GND_IN1.MP 152,2 144.5,9.5
  Bottom 0.406: J4.10 J4.7 142.16,181.54 143,180.47 | J5.7 141.46,174.76 143,176.3 143,180.47 | 143,180.47 J4.5
  Bottom 0.813: 113.55,20.75 v113.64,20.85
  Bottom 1.422: v18.4,90.8 11.1,90.8 4.4,84.1 4.4,63.3 ZENIT_POWER_-.MP 3.8,63.1 1.5,60.8 1.6,37.8 | GND.MP 3.9,35.5 1.7,33.3 1.5,33.1 1.5,18.3 18,1.8 50.6,1.8 BATT_-.MP
  Bottom 1.676: 1.6,37.8 1.7,37.8 1.7,33.3 | BATT_-.MP 52.1,3.9 52.1,1.8 61.2,1.8 ROTOR_POWER_-.MP 61.7,3.9 61.7,1.5 64.1,1.5 64.1,1.2 154.2,1.2 MODULO_GND_IN1.MP
  pour Bottom: 114.2,79.3 165.2,79.3 166.5,78 166.5,8.2 165.4,7.1 165.4,2.6 157.4,-5.4 111.5,-5.4 108.6,-2.5 108.6,73.7
  pour Route2: -5.3,0.2 -5.3,134.3 163,134.3 163,-1.3 -5.3,-1.3
I2C0-SCL  (via drill 0.6)
  Top 0.2: 142.4,66.7 J1.46
  Top 0.813: R4.2 IC3.4 9.52,101.58 10.4,100.7 10.4,38.7 11.1,38 11.1,21.6 25.7,7 43.9,7 46.7,9.8 67.5,9.8 70,12.3 105.4,12.3 108.5,15.4 108.5,21.5 118.3,31.3 120.5,31.3 126.9,37.7 126.9,47.9 v127,48 | v142.5,66.1 142.4,66.2 142.4,66.7
  Bottom 0.813: v127,48 142.5,63.5 v142.5,66.1
I2C0-SDA  (via drill 0.6)
  Top 0.2: 141.3,66.7 142,67.4 J1.44
  Top 0.813: R3.2 4.68,104.12 IC3.3 11.38,104.12 12.4,103.1 12.4,38.8 13,38.2 13,22.1 26.3,8.8 43.5,8.8 46,11.3 66.9,11.3 69.2,13.6 104.7,13.6 107.1,16 107.1,21.8 117.8,32.5 120,32.5 125.7,38.2 125.7,49 v126.8,50.1 | v140.9,64.2 140.9,66.3 141.3,66.7
  Bottom 0.813: v126.8,50.1 v140.9,64.2
N$2  (via drill 0.6)
  Top 0.305: U1.7 -94.7,75.2 v-93.2,73.7 | v-93.2,70.7 LED1.A@1
  Bottom 0.305: v-93.2,73.7 v-93.2,70.7
N$11
  Top 0.305: R5.2 -104,71.8 -101.8,74 -101.8,75.7 -102.3,76.2 U1.2
  Top 0.61: R9.1 -105.5,70.1 -106,70.6 -106,71.75 R5.2
N$12  (via drill 0.6)
  Top 0.305: -100.6,76.9 -100.6,74.4 -99.9,73.7 | -99.9,73.7 -98.5,72.3 -92.7,72.3 -90.6,70.2 -90.6,68.1 -92.6,66.1 -97.4,66.1 -100.1,68.8 -100.1,69.95 R10.2 | U1.3 -102.5,75.7 -102.3,75.5 -102.3,74.2 -103.3,73.2 v-104.3,73.2 | v-98.6,73.7 -99.9,73.7
  Top 0.61: R1.1 -105.85,80.25 -103.6,78 -101.7,78 -100.6,76.9
  Bottom 0.305: v-104.3,73.2 -104.3,72.6 -103.9,72.2 -103.1,72.2 -102.3,73 -99.3,73 v-98.6,73.7
N$13
  Top 0.305: R8.2 -102.2,77.3 -101.1,76.2 -101.1,74 -98.7,71.6 -96.4,71.6 LED1.C@1
N$14
  Top 0.305: U1.10 -91.95,76.7 R6.2
N$15
  Top 0.813: IC1.8 138.6,14.01 140.1,15.5 R2.2
N$23
  Top 0.61: -108.1,77.1 -108,77.2 -108,77.4
PWM5  (via drill 0.5)
  Top 0.2: J2.60 145.2,25.9 145.7,26.4 152.3,26.4 v153.5,27.6
  Top 0.406: v150.9,99.9 150.8,104.77 J5.4 146.54,109.46 145.3,110.7 145.3,174.9 147,176.6 147,179.27 J4.4
  Bottom 0.406: v150.9,99.9 155,95.8 155,52.7 153.5,51.2 v153.5,27.6
PWM9_SYNC  (via drill 0.5)
  Top 0.2: 146.8,23.4 J2.68 146.8,25.9 146.9,26 153.1,26 v153.5,26.4
  Top 0.406: J4.6 144.4,176.7 142.7,175 142.7,110.33 J5.6
  Top 1.27: R7.1 146.8,16.75 146.8,23.4
  Bottom 0.406: J5.6 155.6,97.43 155.6,52.3 154.2,50.9 154.2,30 154.9,29.3 154.9,27 154.3,26.4 v153.5,26.4
RESET  (via drill 0.4, 0.5)
  Top 0.2: J1.73 148,72.8 v148.1,72.9
  Top 0.406: J3.10 122.64,20.54 v123.4,21.5
  Bottom 0.406: v123.4,21.5 123.6,22.4 124.3,23.1 124.3,56.9 127.2,59.8 127.2,69.4 133.3,75.5 140.3,75.5 142.9,72.9 v148.1,72.9
SAO  (via drill 0.5)
  Top 0.2: 141.2,25.7 J2.40 141.2,26.2 140.95,26.45 133.15,26.45 132.2,27.4 132.2,83.1 134,84.9 v134,86.6 | 124.1,91.8 124.1,91.7 125,90.8 v125.4,90.8
  Top 0.406: PIN3.1 121.52,120.52 118.6,117.6 118.6,97.3 124.1,91.8
  Bottom 0.406: v134,86.6 129.8,90.8 v125.4,90.8
SCL  (via drill 0.5)
  Top 0.2: 140.8,23.8 J2.38
  Top 0.406: v140.8,23.3 140.8,23.8
  Bottom 0.406: PIN3.4 129.3,112.9 133.2,109 133.2,103.7 139.8,97.1 147.3,97.1 153.8,90.6 153.8,53.5 140.9,40.6 140.9,23.3 v140.8,23.3
SDA  (via drill 0.5)
  Top 0.2: J2.42 141.6,23.4
  Top 0.406: v141.7,22.4 141.6,22.5 141.6,23.4
  Bottom 0.406: PIN3.3 129.76,115.44 134.7,110.5 134.7,103.4 140.2,97.9 147.5,97.9 154.4,91 154.4,53.1 141.7,40.4 v141.7,22.4
TCK/SWCLK  (via drill 0.4, 0.5)
  Top 0.2: 148.8,73.3 J1.77
  Top 0.406: J3.4 126.25,24.34 v126.6,24.9 | v152.6,74.5 150.3,74.5 148.8,73.3
  Bottom 0.406: v126.6,24.9 127.2,24.9 128,25.7 128,26.3 127.4,26.9 127.4,39.1 145,56.7 145,63 150.2,68.2 151.6,68.2 152.4,69 152.4,71.3 151.5,72.2 151.5,73.4 v152.6,74.5
TDO/SWO  (via drill 0.4, 0.5)
  Top 0.2: 149.2,72.4 J1.79
  Top 0.406: J3.6 126.58,23.07 v126.7,23.4 | v152.8,72.9 149.7,72.9 149.2,72.4
  Bottom 0.406: v126.7,23.4 127.1,23.4 129.1,25.4 129.1,26.4 128.4,27.1 128.4,38.9 146,56.5 146,62.6 150.4,67 152.1,67 153.2,68.1 153.2,72.5 v152.8,72.9
TMS/SWDIO  (via drill 0.4, 0.5)
  Top 0.2: J1.75 148.4,69.8 148.5,69.7 149.1,69.7
  Top 0.406: J3.2 125.92,25.61 v126.5,26.2
  Top 0.813: v151.5,69.7 149.1,69.7
  Bottom 0.406: v151.5,69.7 150.2,69.7 144.1,63.6 144.1,56.9 126.4,39.2 126.4,26.2 v126.5,26.2
VBAT
  Top 0.305: U1.8 U1.9 -93.7,76.2 -92.7,75.2 -90.7,75.2 -89.3,76.6 -89.3,78.5 -91.7,80.9 MOSFET.5
  Top 0.61: MOSFET.5 MOSFET.6 MOSFET.7 MOSFET.8
VBAT_RAW  (via drill 0.6)
  Top 0.305: -105,74.5 -105,76.2 -104.5,76.7 U1.1 | C4.2 -99.2,64.7 -102.35,67.85 R9.2 -102.3,70.15 v-102.3,71.8 | U1.6 -98.2,74.7 v-97.2,73.7 | v-108.4,73.4 -108.4,74.4 -108.05,74.75
  Top 0.61: -105,74.5 -105.8,73.7 -107,73.7 -108.05,74.75 R8.1 -108.05,80.7 R1.2 -103.59,82.15 MOSFET.3 MOSFET.2 MOSFET.1
  Bottom 0.305: v-97.2,73.7 -97.2,72.1 -98.2,71.1 -100.9,71.1 -101.6,71.8 v-102.3,71.8 -102.7,71.4 -106.6,71.4 v-108.4,73.4

### Text on the board
tNames: 9 | 7 | 7 | 5 | 5 | 3 | 1 | 10 | 8 | 6 | 4 | 2 | K1_ROT_V0.1_rev4.5 | SAO | SOX | CS | SCX | SDA | 9 | 7 | 5 | 3 | 1 | INT1 | SCL | INT2 | GND | OCS | 3V3 | 10 | 8 | 6 | 4 | 2 | VIN | 100UF | N/C | P1 | MOT - | VIN-5V | MOT + | MOT - | BAT - | MOT +
tValues: FRONT